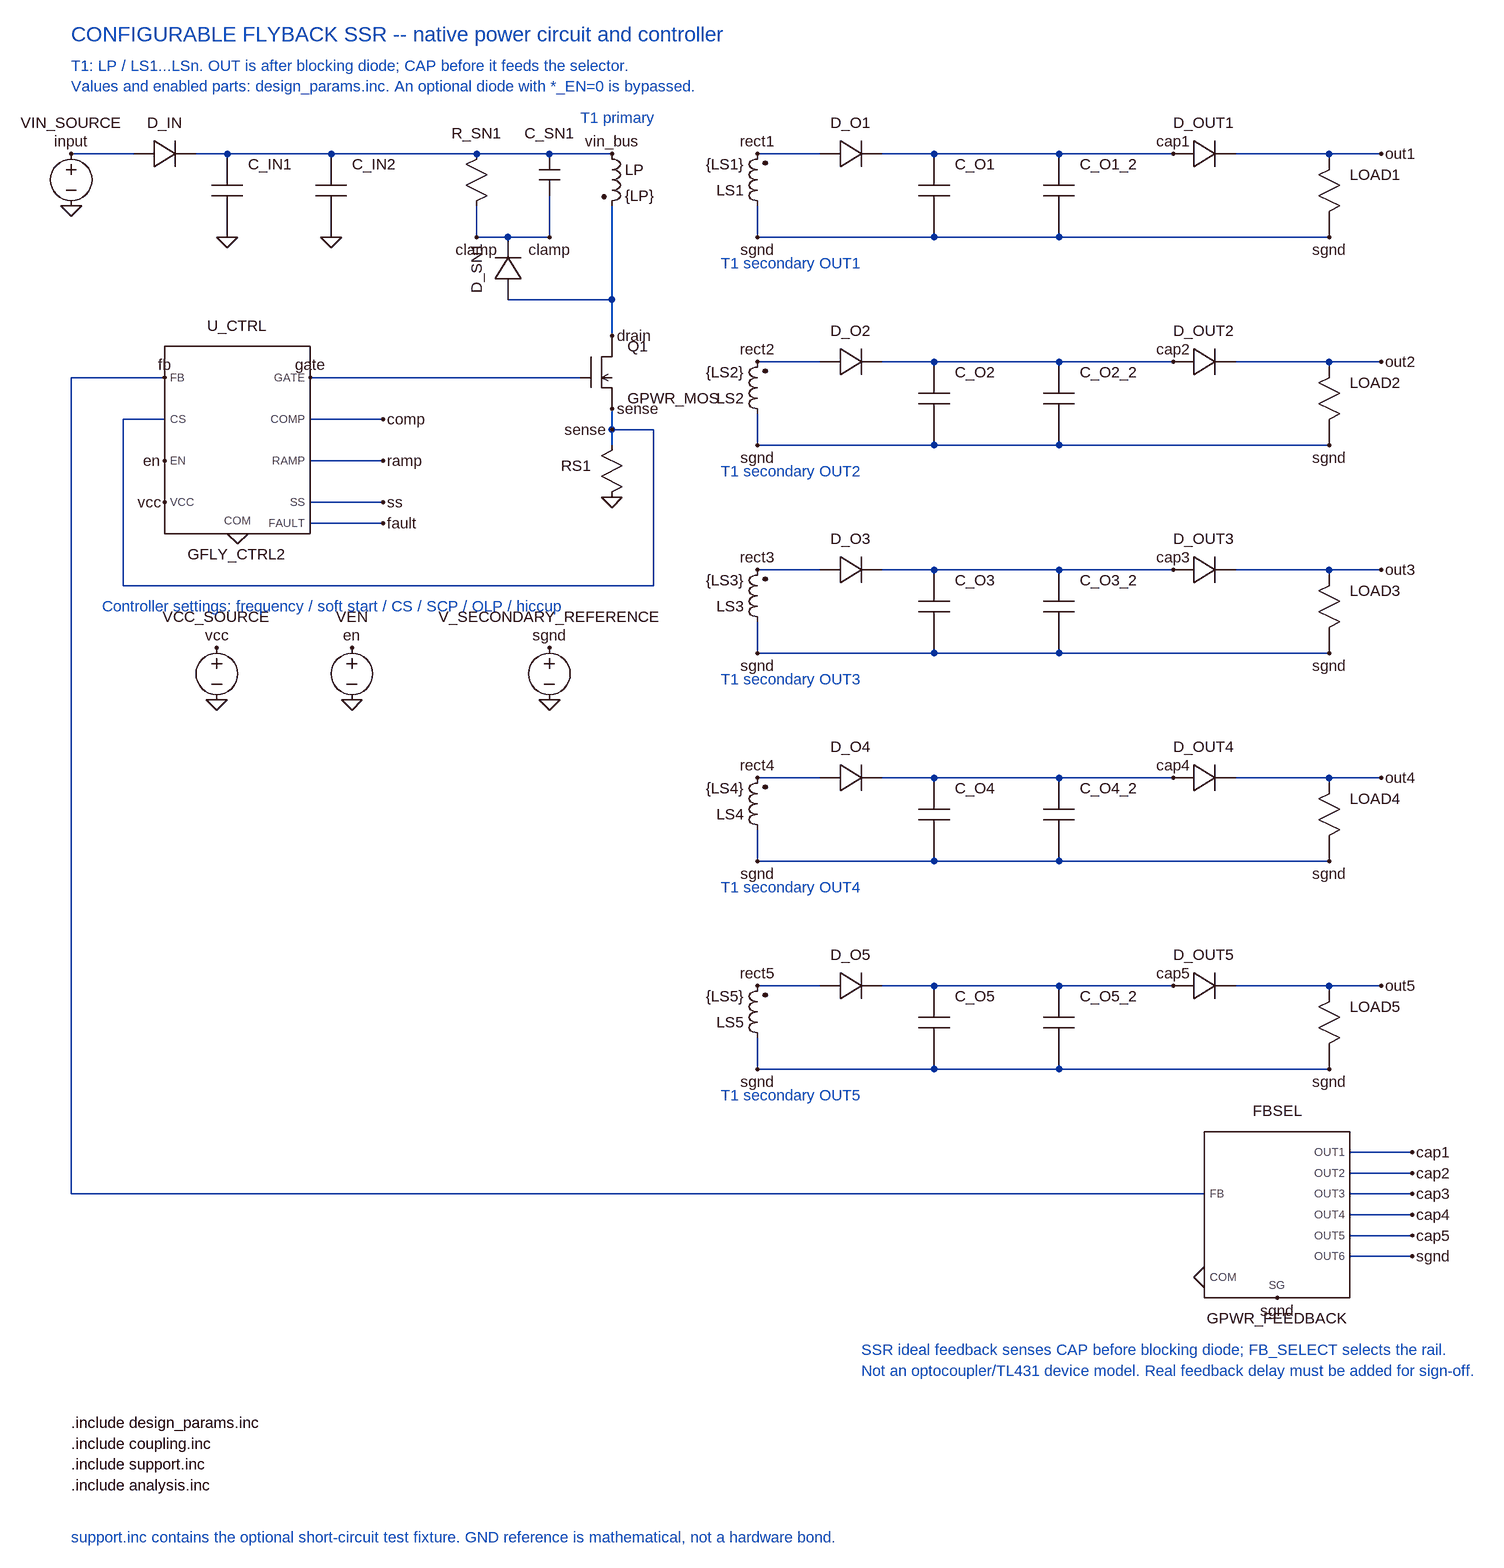
[diagram p0: schematic Flyback_5.asc]
Flyback_5.asc, the LTspice schematic file:
Version 4
SHEET 1 880 680
WIRE 64 200 160 200
WIRE 256 200 896 200
WIRE 688 280 688 328
WIRE 800 264 800 328
WIRE 688 328 800 328
WIRE 896 280 896 480
WIRE 736 424 896 424
WIRE 896 592 896 648
WIRE 432 544 848 544
WIRE 208 608 144 608
WIRE 144 608 144 864
WIRE 144 864 960 864
WIRE 960 864 960 624
WIRE 960 624 896 624
WIRE 432 608 544 608
WIRE 432 672 544 672
WIRE 432 736 544 736
WIRE 432 768 544 768
WIRE 1120 200 1216 200
WIRE 1312 200 1392 200
WIRE 1392 200 1584 200
WIRE 1584 200 1760 200
WIRE 1856 200 2000 200
WIRE 2000 200 2080 200
WIRE 1392 328 1584 328
WIRE 1584 328 2000 328
WIRE 1120 280 1120 328
WIRE 1120 328 1392 328
WIRE 1120 520 1216 520
WIRE 1312 520 1392 520
WIRE 1392 520 1584 520
WIRE 1584 520 1760 520
WIRE 1856 520 2000 520
WIRE 2000 520 2080 520
WIRE 1392 648 1584 648
WIRE 1584 648 2000 648
WIRE 1120 600 1120 648
WIRE 1120 648 1392 648
WIRE 1120 840 1216 840
WIRE 1312 840 1392 840
WIRE 1392 840 1584 840
WIRE 1584 840 1760 840
WIRE 1856 840 2000 840
WIRE 2000 840 2080 840
WIRE 1392 968 1584 968
WIRE 1584 968 2000 968
WIRE 1120 920 1120 968
WIRE 1120 968 1392 968
WIRE 1120 1160 1216 1160
WIRE 1312 1160 1392 1160
WIRE 1392 1160 1584 1160
WIRE 1584 1160 1760 1160
WIRE 1856 1160 2000 1160
WIRE 2000 1160 2080 1160
WIRE 1392 1288 1584 1288
WIRE 1584 1288 2000 1288
WIRE 1120 1240 1120 1288
WIRE 1120 1288 1392 1288
WIRE 1120 1480 1216 1480
WIRE 1312 1480 1392 1480
WIRE 1392 1480 1584 1480
WIRE 1584 1480 1760 1480
WIRE 1856 1480 2000 1480
WIRE 2000 1480 2080 1480
WIRE 1392 1608 1584 1608
WIRE 1584 1608 2000 1608
WIRE 1120 1560 1120 1608
WIRE 1120 1608 1392 1608
WIRE 2032 1736 2128 1736
WIRE 2032 1768 2128 1768
WIRE 2032 1800 2128 1800
WIRE 2032 1832 2128 1832
WIRE 2032 1864 2128 1864
WIRE 2032 1896 2128 1896
WIRE 1808 1800 64 1800
WIRE 64 1800 64 544
WIRE 64 544 208 544
FLAG 64 280 0
FLAG 64 200 input
FLAG 896 200 vin_bus
FLAG 304 328 0
FLAG 464 328 0
FLAG 688 328 clamp
FLAG 800 328 clamp
FLAG 896 480 drain
FLAG 896 728 0
FLAG 896 592 sense
FLAG 432 544 gate
FLAG 896 624 sense
FLAG 544 608 comp
FLAG 544 672 ramp
FLAG 544 736 ss
FLAG 544 768 fault
FLAG 320 784 0
FLAG 208 672 en
FLAG 208 736 vcc
FLAG 288 960 vcc
FLAG 288 1040 0
FLAG 496 960 en
FLAG 496 1040 0
FLAG 1120 200 rect1
FLAG 1760 200 cap1
FLAG 2080 200 out1
FLAG 1120 328 sgnd
FLAG 2000 328 sgnd
FLAG 1120 520 rect2
FLAG 1760 520 cap2
FLAG 2080 520 out2
FLAG 1120 648 sgnd
FLAG 2000 648 sgnd
FLAG 1120 840 rect3
FLAG 1760 840 cap3
FLAG 2080 840 out3
FLAG 1120 968 sgnd
FLAG 2000 968 sgnd
FLAG 1120 1160 rect4
FLAG 1760 1160 cap4
FLAG 2080 1160 out4
FLAG 1120 1288 sgnd
FLAG 2000 1288 sgnd
FLAG 1120 1480 rect5
FLAG 1760 1480 cap5
FLAG 2080 1480 out5
FLAG 1120 1608 sgnd
FLAG 2000 1608 sgnd
FLAG 2128 1736 cap1
FLAG 2128 1768 cap2
FLAG 2128 1800 cap3
FLAG 2128 1832 cap4
FLAG 2128 1864 cap5
FLAG 2128 1896 sgnd
FLAG 1920 1960 sgnd
FLAG 1808 1928 0
FLAG 208 544 fb
FLAG 800 960 sgnd
FLAG 800 1040 0
SYMBOL PowerVoltage 64 184 R0
SYMATTR InstName VIN_SOURCE
SYMATTR Value {VIN}
SYMBOL PowerDiode 160 200 R0
SYMATTR InstName D_IN
SYMATTR Value GPWR_DIODE
SYMATTR SpiceLine VF={D_IN_VF} ACT={D_IN_EN} CJ={DIODE_CJ}
SYMBOL ind2 880 184 R0
SYMATTR InstName LP
SYMATTR Value {LP}
SYMATTR SpiceLine Rser={RP}
SYMBOL PowerCap 288 200 R0
SYMATTR InstName C_IN1
SYMATTR Value GPWR_CAP
SYMATTR SpiceLine C={C_IN1_C} ESR={C_IN1_ESR} ESL={C_IN1_ESL} ACT={C_IN1_EN}
SYMBOL PowerCap 448 200 R0
SYMATTR InstName C_IN2
SYMATTR Value GPWR_CAP
SYMATTR SpiceLine C={C_IN2_C} ESR={C_IN2_ESR} ESL={C_IN2_ESL} ACT={C_IN2_EN}
SYMBOL PowerRes 672 184 R0
SYMATTR InstName R_SN1
SYMATTR Value {R_SN1}
SYMBOL PowerSmallCap 784 200 R0
SYMATTR InstName C_SN1
SYMATTR Value {C_SN1}
SYMATTR SpiceLine Rser=0.01
SYMBOL PowerDiode 736 424 R270
SYMATTR InstName D_SN1
SYMATTR Value GPWR_DIODE
SYMATTR SpiceLine VF={D_SN1_VF} ACT={D_SN1_EN} CJ={DIODE_CJ}
SYMBOL PowerMos 848 480 R0
SYMATTR InstName Q1
SYMATTR Value GPWR_MOS
SYMATTR SpiceLine RON={Q_RON} COSS={Q_COSS} CG={Q_CG} VG={VG} CJ={DIODE_CJ}
SYMBOL PowerSenseRes 880 632 R0
SYMATTR InstName RS1
SYMATTR Value {RSENSE}
SYMBOL GFLY_CTRL2 320 640 R0
SYMATTR InstName U_CTRL
SYMATTR Value GFLY_CTRL2
SYMATTR SpiceLine FSW={FSW} MODE={MODE} DMAX={DMAX} VM={VM} A_CS={A_CS} SLOPE={SLOPE} CS_LIM={CS_LIM} TBLANK={TBLANK} TONMIN={TONMIN} TPROP={TPROP} VG={VG} RDRV={RDRV} UVLO={UVLO} VSET={VSET} TSS={TSS} TYPE={TYPE} KP={KP} FZ1={FZ1} FP1={FP1} FZ2={FZ2} FP2={FP2} CMAX={CMAX} TEN={TEN} SSMODE={SSMODE} SSFRAC={SSFRAC} COFF={COFF} SSCLO={SSCLO} SSCHI={SSCHI} SCMODE={SCMODE} SCP={SCP} SCPBLANK={SCPBLANK} OLPEN={OLPEN} TOLP={TOLP} THOLD={THOLD} TOFF={TOFF} CS_TAU={CS_TAU}
SYMBOL PowerVoltage 288 944 R0
SYMATTR InstName VCC_SOURCE
SYMATTR Value {VG}
SYMBOL PowerVoltage 496 944 R0
SYMATTR InstName VEN
SYMATTR Value PULSE(0 1 1e-6 10e-9 10e-9 {2*TSTOP} {3*TSTOP})
SYMBOL ind2 1136 296 R180
SYMATTR InstName LS1
SYMATTR Value {LS1}
SYMATTR SpiceLine Rser={RS1}
SYMBOL PowerDiode 1216 200 R0
SYMATTR InstName D_O1
SYMATTR Value GPWR_DIODE
SYMATTR SpiceLine VF={D_O1_VF} ACT={D_O1_EN} CJ={DIODE_CJ}
SYMBOL PowerCap 1376 200 R0
SYMATTR InstName C_O1
SYMATTR Value GPWR_CAP
SYMATTR SpiceLine C={C_O1_C} ESR={C_O1_ESR} ESL={C_O1_ESL} ACT={C_O1_EN}
SYMBOL PowerCap 1568 200 R0
SYMATTR InstName C_O1_2
SYMATTR Value GPWR_CAP
SYMATTR SpiceLine C={C_O1_2_C} ESR={C_O1_2_ESR} ESL={C_O1_2_ESL} ACT={C_O1_2_EN}
SYMBOL PowerDiode 1760 200 R0
SYMATTR InstName D_OUT1
SYMATTR Value GPWR_DIODE
SYMATTR SpiceLine VF={D_OUT1_VF} ACT={D_OUT1_EN} CJ={DIODE_CJ}
SYMBOL PowerLoad 1984 200 R0
SYMATTR InstName LOAD1
SYMATTR Value I=V(out1,sgnd)/{RLOAD1}*(1+({LOAD_AFTER}-1)*limit((time-{TLOAD})/1e-6,0,1))
SYMBOL ind2 1136 616 R180
SYMATTR InstName LS2
SYMATTR Value {LS2}
SYMATTR SpiceLine Rser={RS2}
SYMBOL PowerDiode 1216 520 R0
SYMATTR InstName D_O2
SYMATTR Value GPWR_DIODE
SYMATTR SpiceLine VF={D_O2_VF} ACT={D_O2_EN} CJ={DIODE_CJ}
SYMBOL PowerCap 1376 520 R0
SYMATTR InstName C_O2
SYMATTR Value GPWR_CAP
SYMATTR SpiceLine C={C_O2_C} ESR={C_O2_ESR} ESL={C_O2_ESL} ACT={C_O2_EN}
SYMBOL PowerCap 1568 520 R0
SYMATTR InstName C_O2_2
SYMATTR Value GPWR_CAP
SYMATTR SpiceLine C={C_O2_2_C} ESR={C_O2_2_ESR} ESL={C_O2_2_ESL} ACT={C_O2_2_EN}
SYMBOL PowerDiode 1760 520 R0
SYMATTR InstName D_OUT2
SYMATTR Value GPWR_DIODE
SYMATTR SpiceLine VF={D_OUT2_VF} ACT={D_OUT2_EN} CJ={DIODE_CJ}
SYMBOL PowerLoad 1984 520 R0
SYMATTR InstName LOAD2
SYMATTR Value I=V(out2,sgnd)/{RLOAD2}*(1+({LOAD_AFTER}-1)*limit((time-{TLOAD})/1e-6,0,1))
SYMBOL ind2 1136 936 R180
SYMATTR InstName LS3
SYMATTR Value {LS3}
SYMATTR SpiceLine Rser={RS3}
SYMBOL PowerDiode 1216 840 R0
SYMATTR InstName D_O3
SYMATTR Value GPWR_DIODE
SYMATTR SpiceLine VF={D_O3_VF} ACT={D_O3_EN} CJ={DIODE_CJ}
SYMBOL PowerCap 1376 840 R0
SYMATTR InstName C_O3
SYMATTR Value GPWR_CAP
SYMATTR SpiceLine C={C_O3_C} ESR={C_O3_ESR} ESL={C_O3_ESL} ACT={C_O3_EN}
SYMBOL PowerCap 1568 840 R0
SYMATTR InstName C_O3_2
SYMATTR Value GPWR_CAP
SYMATTR SpiceLine C={C_O3_2_C} ESR={C_O3_2_ESR} ESL={C_O3_2_ESL} ACT={C_O3_2_EN}
SYMBOL PowerDiode 1760 840 R0
SYMATTR InstName D_OUT3
SYMATTR Value GPWR_DIODE
SYMATTR SpiceLine VF={D_OUT3_VF} ACT={D_OUT3_EN} CJ={DIODE_CJ}
SYMBOL PowerLoad 1984 840 R0
SYMATTR InstName LOAD3
SYMATTR Value I=V(out3,sgnd)/{RLOAD3}*(1+({LOAD_AFTER}-1)*limit((time-{TLOAD})/1e-6,0,1))
SYMBOL ind2 1136 1256 R180
SYMATTR InstName LS4
SYMATTR Value {LS4}
SYMATTR SpiceLine Rser={RS4}
SYMBOL PowerDiode 1216 1160 R0
SYMATTR InstName D_O4
SYMATTR Value GPWR_DIODE
SYMATTR SpiceLine VF={D_O4_VF} ACT={D_O4_EN} CJ={DIODE_CJ}
SYMBOL PowerCap 1376 1160 R0
SYMATTR InstName C_O4
SYMATTR Value GPWR_CAP
SYMATTR SpiceLine C={C_O4_C} ESR={C_O4_ESR} ESL={C_O4_ESL} ACT={C_O4_EN}
SYMBOL PowerCap 1568 1160 R0
SYMATTR InstName C_O4_2
SYMATTR Value GPWR_CAP
SYMATTR SpiceLine C={C_O4_2_C} ESR={C_O4_2_ESR} ESL={C_O4_2_ESL} ACT={C_O4_2_EN}
SYMBOL PowerDiode 1760 1160 R0
SYMATTR InstName D_OUT4
SYMATTR Value GPWR_DIODE
SYMATTR SpiceLine VF={D_OUT4_VF} ACT={D_OUT4_EN} CJ={DIODE_CJ}
SYMBOL PowerLoad 1984 1160 R0
SYMATTR InstName LOAD4
SYMATTR Value I=V(out4,sgnd)/{RLOAD4}*(1+({LOAD_AFTER}-1)*limit((time-{TLOAD})/1e-6,0,1))
SYMBOL ind2 1136 1576 R180
SYMATTR InstName LS5
SYMATTR Value {LS5}
SYMATTR SpiceLine Rser={RS5}
SYMBOL PowerDiode 1216 1480 R0
SYMATTR InstName D_O5
SYMATTR Value GPWR_DIODE
SYMATTR SpiceLine VF={D_O5_VF} ACT={D_O5_EN} CJ={DIODE_CJ}
SYMBOL PowerCap 1376 1480 R0
SYMATTR InstName C_O5
SYMATTR Value GPWR_CAP
SYMATTR SpiceLine C={C_O5_C} ESR={C_O5_ESR} ESL={C_O5_ESL} ACT={C_O5_EN}
SYMBOL PowerCap 1568 1480 R0
SYMATTR InstName C_O5_2
SYMATTR Value GPWR_CAP
SYMATTR SpiceLine C={C_O5_2_C} ESR={C_O5_2_ESR} ESL={C_O5_2_ESL} ACT={C_O5_2_EN}
SYMBOL PowerDiode 1760 1480 R0
SYMATTR InstName D_OUT5
SYMATTR Value GPWR_DIODE
SYMATTR SpiceLine VF={D_OUT5_VF} ACT={D_OUT5_EN} CJ={DIODE_CJ}
SYMBOL PowerLoad 1984 1480 R0
SYMATTR InstName LOAD5
SYMATTR Value I=V(out5,sgnd)/{RLOAD5}*(1+({LOAD_AFTER}-1)*limit((time-{TLOAD})/1e-6,0,1))
SYMBOL FeedbackSelector 1920 1832 R0
SYMATTR InstName FBSEL
SYMATTR Value GPWR_FEEDBACK
SYMATTR SpiceLine SEL={FB_SELECT} H={FB_SCALE}
SYMBOL PowerVoltage 800 944 R0
SYMATTR InstName V_SECONDARY_REFERENCE
SYMATTR Value 0
TEXT 64 16 Left 3 ;CONFIGURABLE FLYBACK SSR -- native power circuit and controller
TEXT 64 64 Left 2 ;T1: LP / LS1...LSn. OUT is after blocking diode; CAP before it feeds the selector.
TEXT 64 96 Left 2 ;Values and enabled parts: design_params.inc. An optional diode with *_EN=0 is bypassed.
TEXT 848 144 Left 2 ;T1 primary
TEXT 112 896 Left 2 ;Controller settings: frequency / soft start / CS / SCP / OLP / hiccup
TEXT 1064 368 Left 2 ;T1 secondary OUT1
TEXT 1064 688 Left 2 ;T1 secondary OUT2
TEXT 1064 1008 Left 2 ;T1 secondary OUT3
TEXT 1064 1328 Left 2 ;T1 secondary OUT4
TEXT 1064 1648 Left 2 ;T1 secondary OUT5
TEXT 1280 2040 Left 2 ;SSR ideal feedback senses CAP before blocking diode; FB_SELECT selects the rail.
TEXT 1280 2072 Left 2 ;Not an optocoupler/TL431 device model. Real feedback delay must be added for sign-off.
TEXT 64 2152 Left 2 !.include design_params.inc
TEXT 64 2184 Left 2 !.include coupling.inc
TEXT 64 2216 Left 2 !.include support.inc
TEXT 64 2248 Left 2 !.include analysis.inc
TEXT 64 2328 Left 2 ;support.inc contains the optional short-circuit test fixture. GND reference is mathematical, not a hardware bond.

The netlist it stands for:
* Flyback_5.asc
VIN_SOURCE input 0 {VIN}
XD_IN input vin_bus GPWR_DIODE VF={D_IN_VF} ACT={D_IN_EN} CJ={DIODE_CJ}  ; pins A K
LP vin_bus drain {LP} Rser={RP}
XC_IN1 vin_bus 0 GPWR_CAP C={C_IN1_C} ESR={C_IN1_ESR} ESL={C_IN1_ESL} ACT={C_IN1_EN}  ; pins P N
XC_IN2 vin_bus 0 GPWR_CAP C={C_IN2_C} ESR={C_IN2_ESR} ESL={C_IN2_ESL} ACT={C_IN2_EN}  ; pins P N
R_SN1 vin_bus clamp {R_SN1}
C_SN1 vin_bus clamp {C_SN1} Rser=0.01
XD_SN1 drain clamp GPWR_DIODE VF={D_SN1_VF} ACT={D_SN1_EN} CJ={DIODE_CJ}  ; pins A K
XQ1 drain gate sense GPWR_MOS RON={Q_RON} COSS={Q_COSS} CG={Q_CG} VG={VG} CJ={DIODE_CJ}  ; pins D G S
RS1 sense 0 {RSENSE}
XU_CTRL fb sense en vcc gate comp ramp ss fault 0 GFLY_CTRL2 FSW={FSW} MODE={MODE} DMAX={DMAX} VM={VM} A_CS={A_CS} SLOPE={SLOPE} CS_LIM={CS_LIM} TBLANK={TBLANK} TONMIN={TONMIN} TPROP={TPROP} VG={VG} RDRV={RDRV} UVLO={UVLO} VSET={VSET} TSS={TSS} TYPE={TYPE} KP={KP} FZ1={FZ1} FP1={FP1} FZ2={FZ2} FP2={FP2} CMAX={CMAX} TEN={TEN} SSMODE={SSMODE} SSFRAC={SSFRAC} COFF={COFF} SSCLO={SSCLO} SSCHI={SSCHI} SCMODE={SCMODE} SCP={SCP} SCPBLANK={SCPBLANK} OLPEN={OLPEN} TOLP={TOLP} THOLD={THOLD} TOFF={TOFF} CS_TAU={CS_TAU}  ; pins FB CS EN VCC GATE COMP RAMP SS FAULT COM
VCC_SOURCE vcc 0 {VG}
VEN en 0 PULSE(0 1 1e-6 10e-9 10e-9 {2*TSTOP} {3*TSTOP})
LS1 sgnd rect1 {LS1} Rser={RS1}
XD_O1 rect1 cap1 GPWR_DIODE VF={D_O1_VF} ACT={D_O1_EN} CJ={DIODE_CJ}  ; pins A K
XC_O1 cap1 sgnd GPWR_CAP C={C_O1_C} ESR={C_O1_ESR} ESL={C_O1_ESL} ACT={C_O1_EN}  ; pins P N
XC_O1_2 cap1 sgnd GPWR_CAP C={C_O1_2_C} ESR={C_O1_2_ESR} ESL={C_O1_2_ESL} ACT={C_O1_2_EN}  ; pins P N
XD_OUT1 cap1 out1 GPWR_DIODE VF={D_OUT1_VF} ACT={D_OUT1_EN} CJ={DIODE_CJ}  ; pins A K
B§LOAD1 out1 sgnd I=V(out1,sgnd)/{RLOAD1}*(1+({LOAD_AFTER}-1)*limit((time-{TLOAD})/1e-6,0,1))
LS2 sgnd rect2 {LS2} Rser={RS2}
XD_O2 rect2 cap2 GPWR_DIODE VF={D_O2_VF} ACT={D_O2_EN} CJ={DIODE_CJ}  ; pins A K
XC_O2 cap2 sgnd GPWR_CAP C={C_O2_C} ESR={C_O2_ESR} ESL={C_O2_ESL} ACT={C_O2_EN}  ; pins P N
XC_O2_2 cap2 sgnd GPWR_CAP C={C_O2_2_C} ESR={C_O2_2_ESR} ESL={C_O2_2_ESL} ACT={C_O2_2_EN}  ; pins P N
XD_OUT2 cap2 out2 GPWR_DIODE VF={D_OUT2_VF} ACT={D_OUT2_EN} CJ={DIODE_CJ}  ; pins A K
B§LOAD2 out2 sgnd I=V(out2,sgnd)/{RLOAD2}*(1+({LOAD_AFTER}-1)*limit((time-{TLOAD})/1e-6,0,1))
LS3 sgnd rect3 {LS3} Rser={RS3}
XD_O3 rect3 cap3 GPWR_DIODE VF={D_O3_VF} ACT={D_O3_EN} CJ={DIODE_CJ}  ; pins A K
XC_O3 cap3 sgnd GPWR_CAP C={C_O3_C} ESR={C_O3_ESR} ESL={C_O3_ESL} ACT={C_O3_EN}  ; pins P N
XC_O3_2 cap3 sgnd GPWR_CAP C={C_O3_2_C} ESR={C_O3_2_ESR} ESL={C_O3_2_ESL} ACT={C_O3_2_EN}  ; pins P N
XD_OUT3 cap3 out3 GPWR_DIODE VF={D_OUT3_VF} ACT={D_OUT3_EN} CJ={DIODE_CJ}  ; pins A K
B§LOAD3 out3 sgnd I=V(out3,sgnd)/{RLOAD3}*(1+({LOAD_AFTER}-1)*limit((time-{TLOAD})/1e-6,0,1))
LS4 sgnd rect4 {LS4} Rser={RS4}
XD_O4 rect4 cap4 GPWR_DIODE VF={D_O4_VF} ACT={D_O4_EN} CJ={DIODE_CJ}  ; pins A K
XC_O4 cap4 sgnd GPWR_CAP C={C_O4_C} ESR={C_O4_ESR} ESL={C_O4_ESL} ACT={C_O4_EN}  ; pins P N
XC_O4_2 cap4 sgnd GPWR_CAP C={C_O4_2_C} ESR={C_O4_2_ESR} ESL={C_O4_2_ESL} ACT={C_O4_2_EN}  ; pins P N
XD_OUT4 cap4 out4 GPWR_DIODE VF={D_OUT4_VF} ACT={D_OUT4_EN} CJ={DIODE_CJ}  ; pins A K
B§LOAD4 out4 sgnd I=V(out4,sgnd)/{RLOAD4}*(1+({LOAD_AFTER}-1)*limit((time-{TLOAD})/1e-6,0,1))
LS5 sgnd rect5 {LS5} Rser={RS5}
XD_O5 rect5 cap5 GPWR_DIODE VF={D_O5_VF} ACT={D_O5_EN} CJ={DIODE_CJ}  ; pins A K
XC_O5 cap5 sgnd GPWR_CAP C={C_O5_C} ESR={C_O5_ESR} ESL={C_O5_ESL} ACT={C_O5_EN}  ; pins P N
XC_O5_2 cap5 sgnd GPWR_CAP C={C_O5_2_C} ESR={C_O5_2_ESR} ESL={C_O5_2_ESL} ACT={C_O5_2_EN}  ; pins P N
XD_OUT5 cap5 out5 GPWR_DIODE VF={D_OUT5_VF} ACT={D_OUT5_EN} CJ={DIODE_CJ}  ; pins A K
B§LOAD5 out5 sgnd I=V(out5,sgnd)/{RLOAD5}*(1+({LOAD_AFTER}-1)*limit((time-{TLOAD})/1e-6,0,1))
XFBSEL cap1 cap2 cap3 cap4 cap5 sgnd sgnd fb 0 GPWR_FEEDBACK SEL={FB_SELECT} H={FB_SCALE}  ; pins OUT1 OUT2 OUT3 OUT4 OUT5 OUT6 SG FB COM
V_SECONDARY_REFERENCE sgnd 0 0
* CONFIGURABLE FLYBACK SSR -- native power circuit and controller
* T1: LP / LS1...LSn. OUT is after blocking diode; CAP before it feeds the selector.
* Values and enabled parts: design_params.inc. An optional diode with *_EN=0 is bypassed.
* T1 primary
* Controller settings: frequency / soft start / CS / SCP / OLP / hiccup
* T1 secondary OUT1
* T1 secondary OUT2
* T1 secondary OUT3
* T1 secondary OUT4
* T1 secondary OUT5
* SSR ideal feedback senses CAP before blocking diode; FB_SELECT selects the rail.
* Not an optocoupler/TL431 device model. Real feedback delay must be added for sign-off.
.include design_params.inc
.include coupling.inc
.include support.inc
.include analysis.inc
* support.inc contains the optional short-circuit test fixture. GND reference is mathematical, not a hardware bond.
.lib GenericFlybackPWM.lib
.backanno
.end